# Altium schematic sheet DebugBoard3V3Mux.SchDoc
size 420 x 297 mm; SheetNumber: 4; SheetTotal: 6
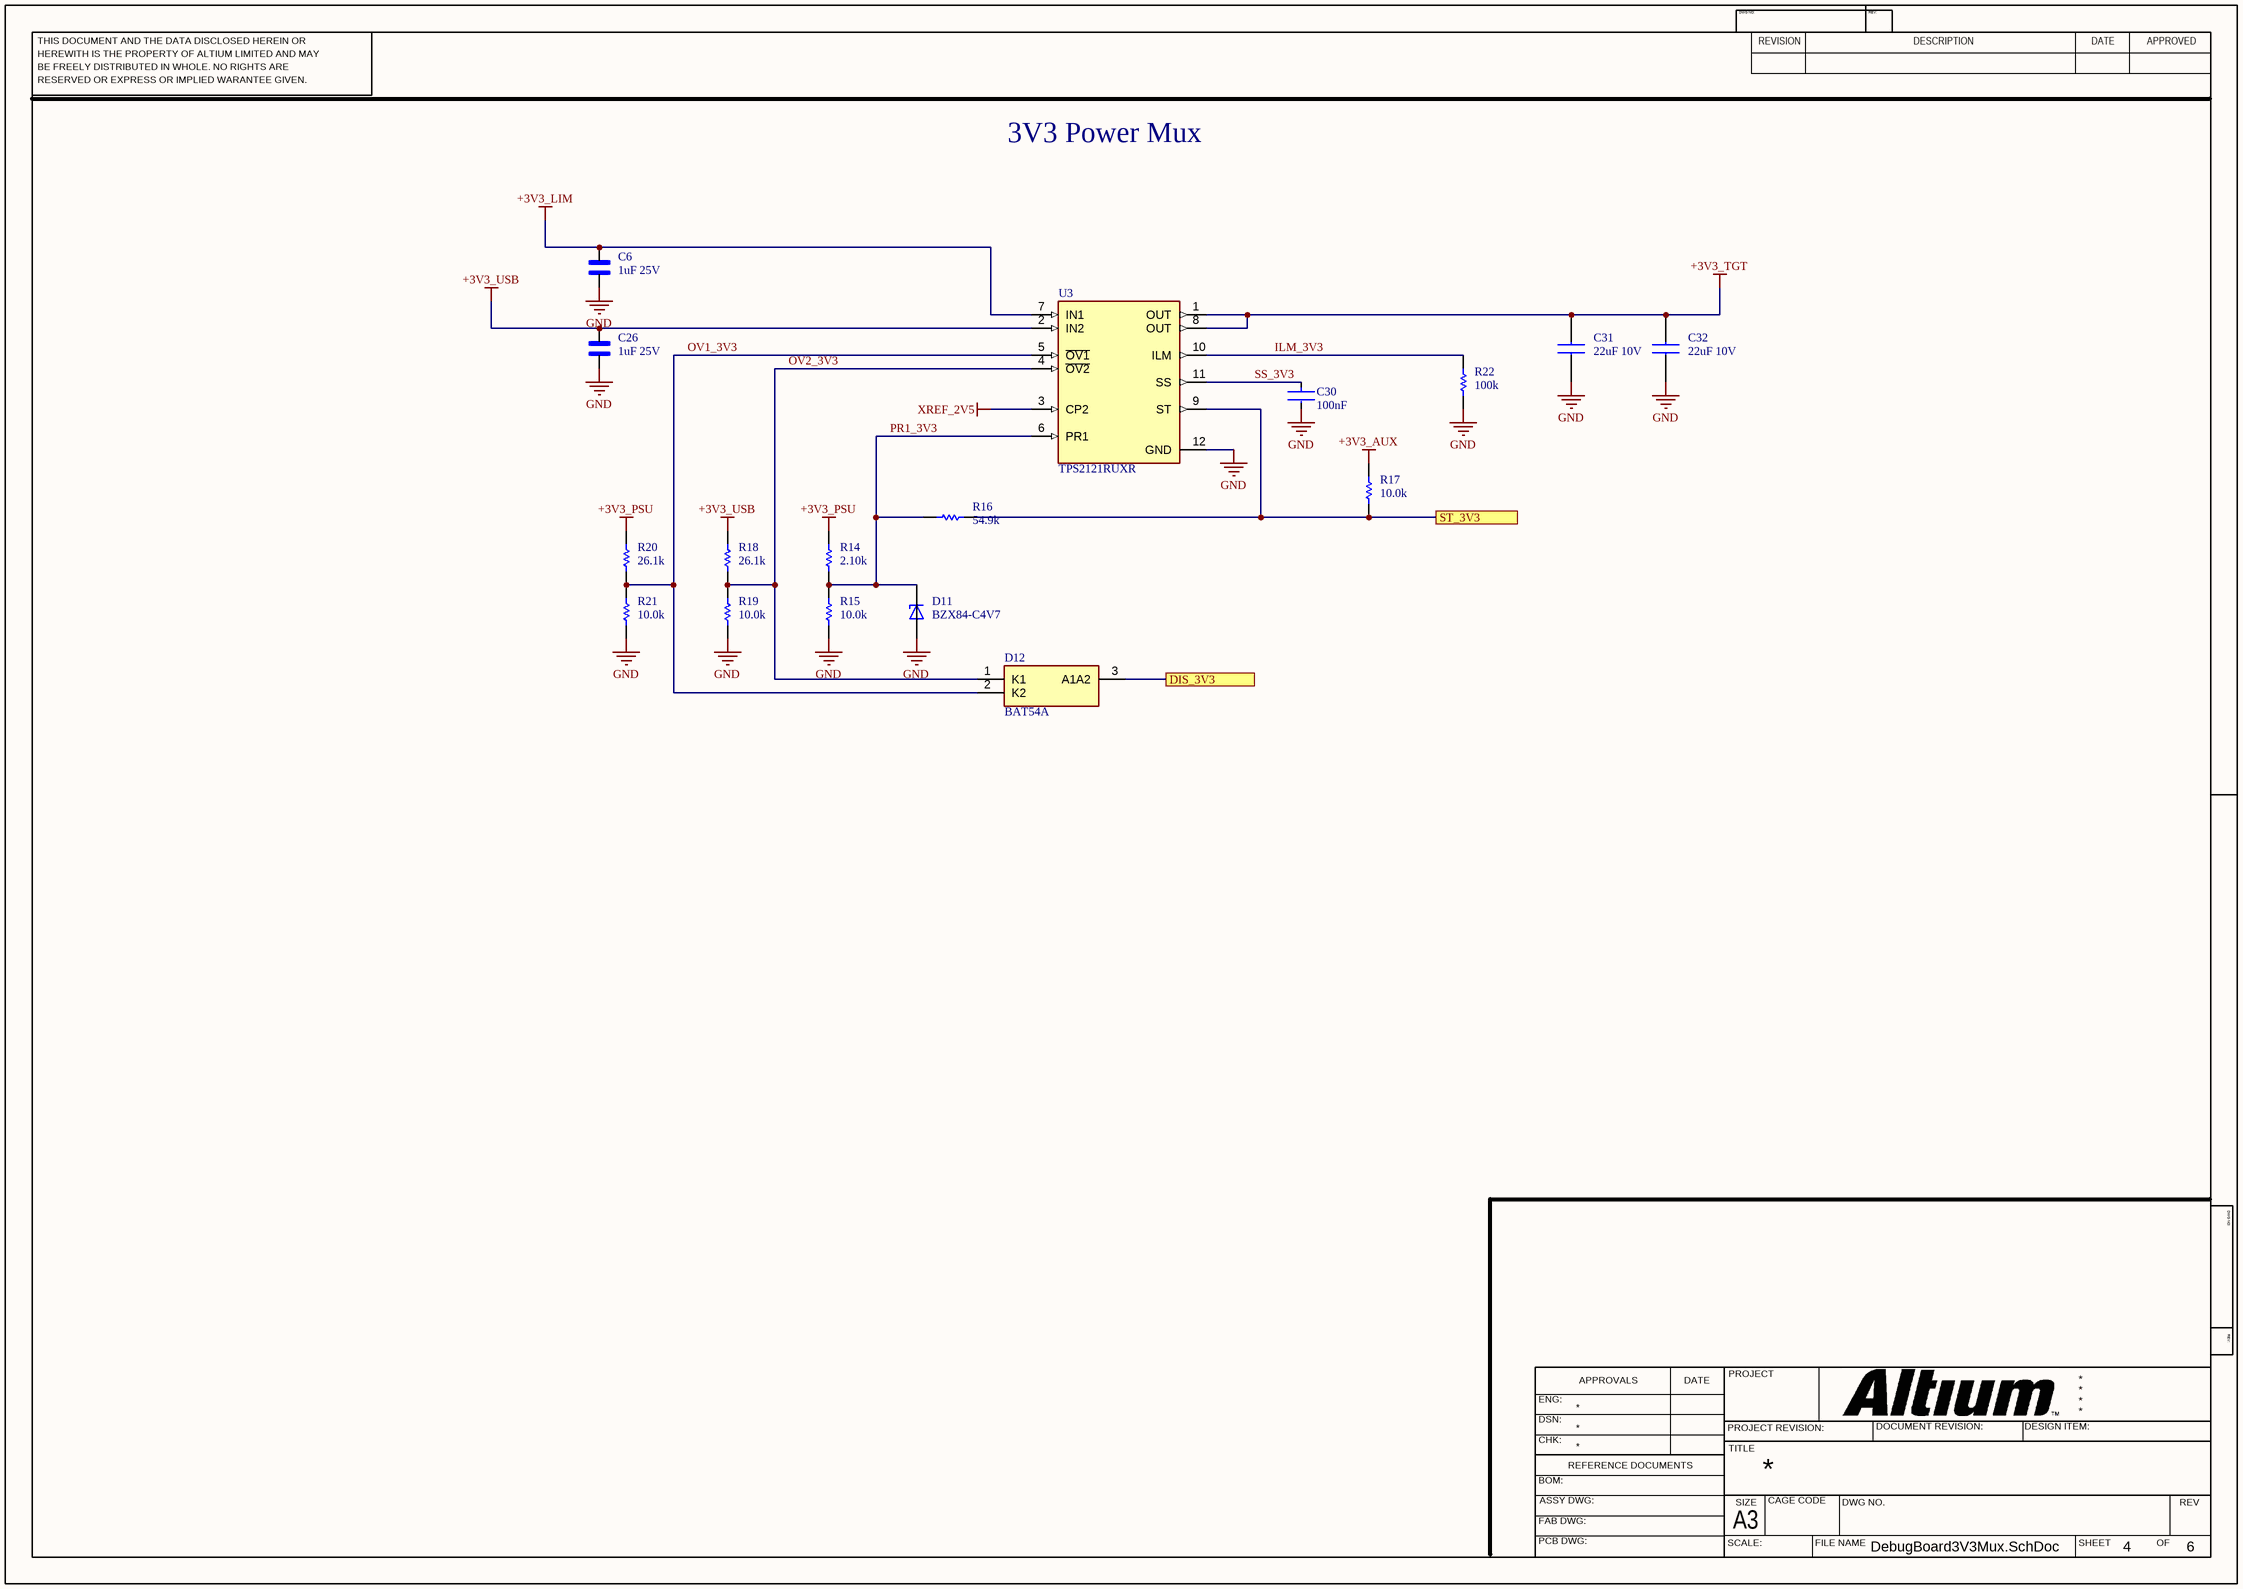
[diagram p0: DebugBoard3V3Mux.SchDoc]

## Parts
C6  1uF 25V  [CAPC2012X135N]
C26  1uF 25V  [CAPC2012X135N]
C30  100nF  [FP-C0805C-DN-MFG]
C31  22uF 10V  [CAPC3116X180N]
C32  22uF 10V  [CAPC3116X180N]
D11  BZX84-C4V7  [SOT95P230X110-3N]
D12  BAT54A  [SOT95P230X110-3N]
R14  2.10k  [RES_0805]
R15  10.0k  [RES_0805]
R16  54.9k  [RES_0805]
R17  10.0k  [RES_0805]
R18  26.1k  [RES_0805]
R19  10.0k  [RES_0805]
R20  26.1k  [RES_0805]
R21  10.0k  [RES_0805]
R22  100k  [RES_0805]
U3  TPS2121RUXR  [FP-RUX0012A-MFG]

## Ports
DIS_3V3, ST_3V3

## Nets
+3V3_AUX: R17.2
+3V3_LIM: C6.1 U3.7(IN1)
+3V3_PSU: R14.1 R20.1
+3V3_TGT: C31.1 C32.1 U3.1(OUT) U3.8(OUT)
+3V3_USB: C26.1 R18.1 U3.2(IN2)
GND: C6.2 C26.2 C30.2 C31.2 C32.2 D11.1(A) R15.2 R19.2 R21.2 R22.2 U3.12(GND)
XREF_2V5: U3.3(CP2)
DIS_3V3: D12.3(A1A2) ; port DIS_3V3
ILM_3V3: R22.1 U3.10(ILM)
OV1_3V3: D12.2(K2) R20.2 R21.1 U3.5(~{OV1})
OV2_3V3: D12.1(K1) R18.2 R19.1 U3.4(~{OV2})
PR1_3V3: D11.3(C) R14.2 R15.1 R16.1 U3.6(PR1)
SS_3V3: C30.1 U3.11(SS)
ST_3V3: R16.2 R17.1 U3.9(ST) ; port ST_3V3

## Notes on the sheet
- 3V3 Power Mux
- THIS DOCUMENT AND THE DATA DISCLOSED HEREIN OR
- HEREWITH IS THE PROPERTY OF ALTIUM LIMITED AND MAY
- DWG NO:
- REVISION
- REV:
- DESCRIPTION
- DATE
- APPROVED
- BE FREELY DISTRIBUTED IN WHOLE. NO RIGHTS ARE
- RESERVED OR EXPRESS OR IMPLIED WARANTEE GIVEN.
- ENG:
- APPROVALS
- PROJECT
- DSN:
- CHK:
- REFERENCE DOCUMENTS
- PROJECT REVISION:
- TITLE
- DOCUMENT REVISION:
- DESIGN ITEM:
- BOM:
- FAB DWG:
- PCB DWG:
- ASSY DWG:
- SCALE:
- A3
- SIZE
- CAGE CODE
- FILE NAME
- DWG NO.
- SHEET
- OF
- REV

## Library data of the parts
C6 C26 = CL21B105KAFNNNE: 1 ÂµF Â±10% 25V Ceramic Capacitor X7R 0805 (2012 Metric); MF: Samsung Electro-Mechanics; SnapEDA_Link: https://www.snapeda.com/parts/CL21B105KAFNNNE/Samsung/view-part/?ref=snap; Package: SMD-2 Samsung; Value: 1uF 25V; MP: CL21B105KAFNNNE; Check_prices: https://www.snapeda.com/parts/CL21B105KAFNNNE/Samsung/view-part/?ref=eda
C30 = CMP-03020-000950-1: CAP CER 0.1UF 50V X7R 0805; Manufacturer: KEMET; Manufacturer Part Number: C0805C104J5RACTU; Temperature Coefficient: 30ppm/°C; Value: 0.10 μF; Material: Ceramic; Tolerance: 0.05; Voltage Rating: 50 V; Digikey Description: CAP CER 0.1UF 50V X7R 0805; Octopart: https://octopart.com/c0805c104j5ractu-kemet-104634; RoHS: TRUE; Device Class L1: Passive Components; Temperature Characteristic: X7R; Device Class L3: Ceramic Capacitors; Lead Free: Yes; Automotive: No; Category: Cap; Temperature: -55°C to +125°C; Package: C0805C-DN; Temperature Range High: +125°C; Height: 0.88mm; Capacitance: 0.10 μF; Temperature Range Low: -55°C; ComponentLink2Description: Datasheet; ComponentLink2URL: https://content.kemet.com/datasheets/KEM_C1003_C0G_SMD.pdf; Ipc Land Pattern Name: CAPC200125X78; Device Class L2: Capacitors; Mouser Description: Multilayer Ceramic Capacitors MLCC - SMD/SMT 50volts 0.1uF X7R 5%
C31 C32 = GCM31CR71A226KE02K: Capacitor GCM31 L=3.2mm W=1.6mm T=1.6mm; Manufacturer_Name: Murata Electronics; Geometry.Height: 1.8mm; Manufacturer_Part_Number: GCM31CR71A226KE02K; Mouser Part Number: 81-GCM31CR71A226KE2K; Mouser Price/Stock: https://www.mouser.co.uk/ProductDetail/Murata-Electronics/GCM31CR71A226KE02K?qs=QzBtWTOodeVgM6QlH6X51g%3D%3D; Arrow Part Number: GCM31CR71A226KE02K; Arrow Price/Stock: https://www.arrow.com/en/products/gcm31cr71a226ke02k/murata-manufacturing?region=nac; Datasheet Link: https://search.murata.co.jp/Ceramy/image/img/A01X/G101/ENG/GCM31CR71A226KE02-01A.pdf
D11 = BZX84-C4V7,215: MF: {'manufacturer': u'Nexperia USA Inc.'}; Package: None; Price: None; Value: BZX84-C4V7; MP: BZX84-C4V7,215; Availability: Unavailable
D12 = BAT54A_215: Diode Array 1 Pair Common Anode 30 V 200mA (DC) Surface Mount TO-236-3, SC-59, SOT-23-3; Manufacturer_Name: Nexperia; Manufacturer_Part_Number: BAT54A,215; Geometry.Height: 1.1mm; Mouser Part Number: 771-BAT54A-T/R; Mouser Price/Stock: https://www.mouser.co.uk/ProductDetail/Nexperia/BAT54A215?qs=me8TqzrmIYV%252BITv%2F8aeieg%3D%3D; Arrow Part Number: BAT54A,215; Arrow Price/Stock: https://www.arrow.com/en/products/bat54a215/nexperia.html?utm_currency=USD&region=europe; Datasheet Link: https://assets.nexperia.com/documents/data-sheet/BAT54A.pdf
R14-R22 = CMP-009-00183-1: Resistor SMD 0805 - Generic; Source: Generic_Schematic_Library.SchLib; Design Item ID: RES_0805
U3 = CMP-019-00076-1: 2.7-V to 22-V, 56-mΩ, 4.5-A, power mux with seamless switchover 12-VQFN-HR -40 to 125; Min Supply Voltage: 2.8V; Max Supply Voltage: 22V; Nominal Supply Current: 300µA; Max Operating Temperature: 125°C; Output Voltage: 22V; Pins: 12; Min Operating Temperature: -40°C